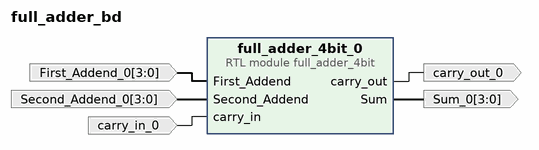
[diagram p0: block diagram of the top level]
# Vivado block design full_adder_bd, xc7z020clg484-1, Vivado 2023.2
create_bd_design full_adder_bd

create_bd_port -dir I -from 3 -to 0 First_Addend_0
create_bd_port -dir I -from 3 -to 0 Second_Addend_0
create_bd_port -dir O -from 3 -to 0 Sum_0
create_bd_port -dir I carry_in_0
create_bd_port -dir O carry_out_0

create_bd_cell -type module -reference full_adder_4bit full_adder_4bit_0

# ---- connections ----

connect_bd_net -net First_Addend_0_1 [get_bd_ports First_Addend_0] [get_bd_pins full_adder_4bit_0/First_Addend]
connect_bd_net -net Second_Addend_0_1 [get_bd_ports Second_Addend_0] [get_bd_pins full_adder_4bit_0/Second_Addend]
connect_bd_net -net carry_in_0_1 [get_bd_ports carry_in_0] [get_bd_pins full_adder_4bit_0/carry_in]
connect_bd_net [get_bd_pins full_adder_4bit_0/Sum] [get_bd_ports Sum_0]
connect_bd_net [get_bd_pins full_adder_4bit_0/carry_out] [get_bd_ports carry_out_0]

validate_bd_design
save_bd_design
